# Altium project AltiumSTM32_PCB.PrjPcb
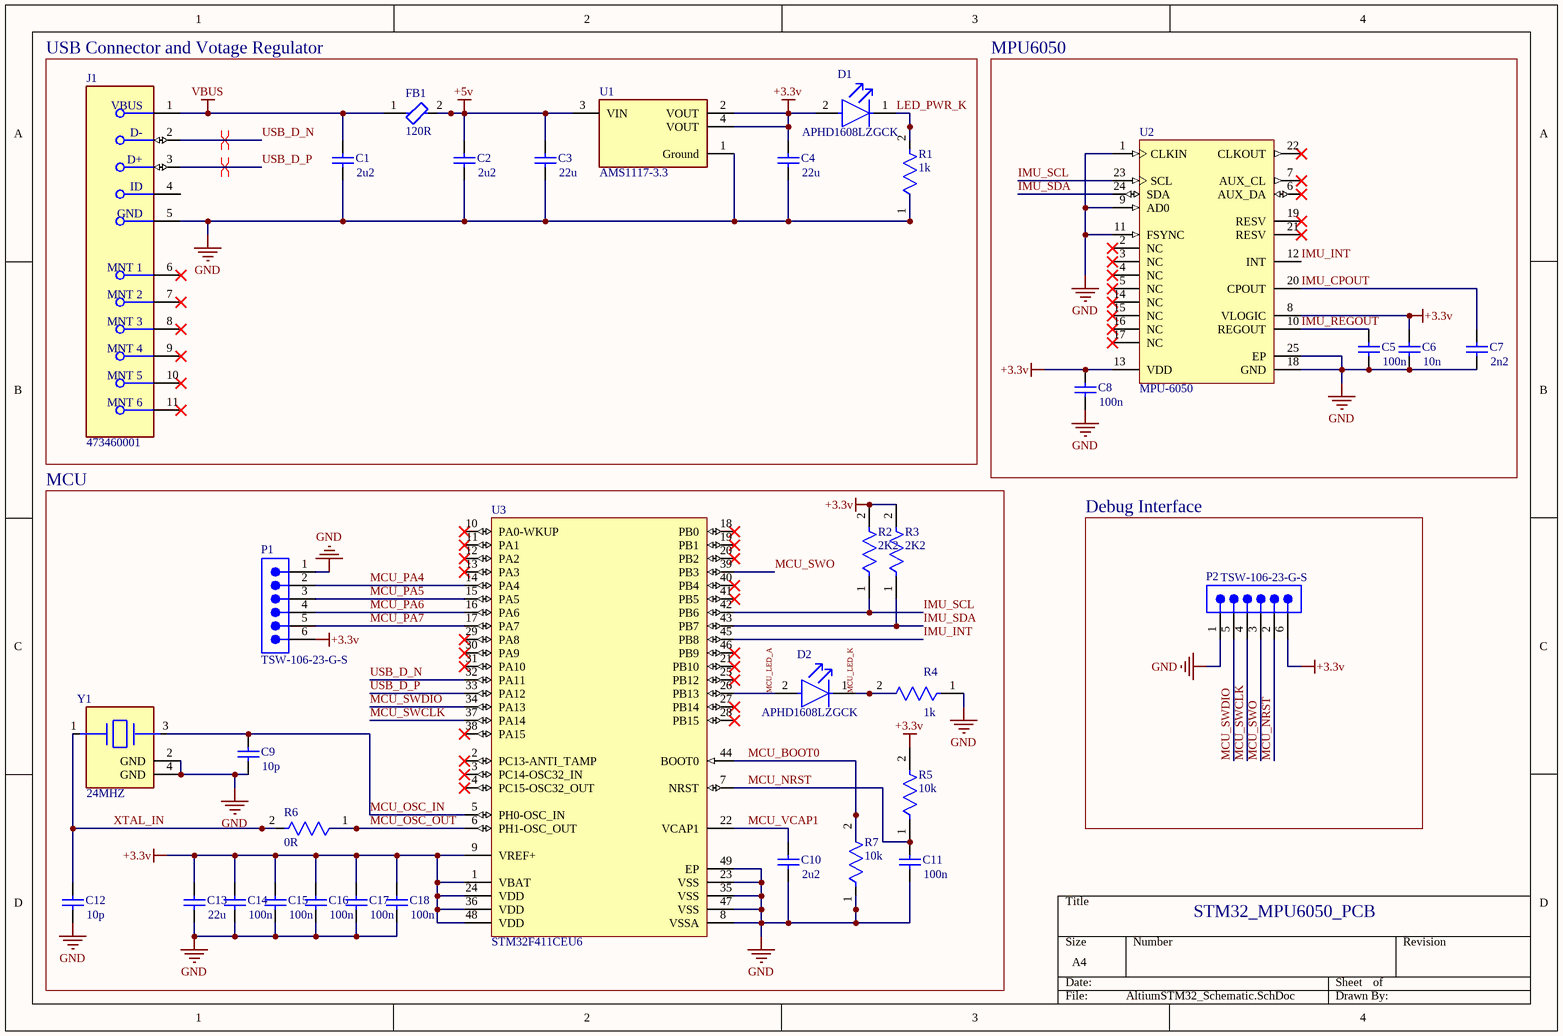
[diagram p0: AltiumSTM32_Schematic.SchDoc]
1 sheet, 35 parts. Net scope: global (net labels, ports and power ports of the same name join across sheets).
Board file: AltiumSTM32_PCB.PcbDoc

## Sheet AltiumSTM32_Schematic.SchDoc: STM32_Board
size A4; Revision: v1.0; SheetNumber: 1; SheetTotal: 1

### Parts
C1  2u2  [CAPC1608X92X38NL15T08]
C2  2u2  [CAPC1608X92X38NL15T08]
C3  22u  [CAPC1608X92X38NL15T08]
C4  22u  [CAPC1608X92X38NL15T08]
C5  100n  [CAPC1608X92X38NL15T08]
C6  10n  [CAPC1608X92X38NL15T08]
C7  2n2  [CAPC1608X92X38NL15T08]
C8  100n  [CAPC1608X92X38NL15T08]
C9  10p  [CAPC1608X92X38NL15T08]
C10  2u2  [CAPC1608X92X38NL15T08]
C11  100n  [CAPC1608X92X38NL15T08]
C12  10p  [CAPC1608X92X38NL15T08]
C13  22u  [CAPC1608X92X38NL15T08]
C14  100n  [CAPC1608X92X38NL15T08]
C15  100n  [CAPC1608X92X38NL15T08]
C16  100n  [CAPC1608X92X38NL15T08]
C17  100n  [CAPC1608X92X38NL15T08]
C18  100n  [CAPC1608X92X38NL15T08]
D1  APHD1608LZGCK  [FP-APHD1608LZGCK-MFG]
D2  APHD1608LZGCK  [FP-APHD1608LZGCK-MFG]
FB1  120R  [FP-MMZ0603-IPC_C]
J1  473460001  [FP-473460001-MFG]
P1  TSW-106-23-G-S  [SMTC-TSW-106-23-X-S]
P2  TSW-106-23-G-S  [SMTC-TSW-106-23-X-S]
R1  1k  [FP-AC0603-IPC_A]
R2  2K2  [FP-AC0603-IPC_A]
R3  2K2  [FP-AC0603-IPC_A]
R4  1k  [FP-AC0603-IPC_A]
R5  10k  [FP-AC0603-IPC_A]
R6  0R  [FP-AC0603-IPC_A]
R7  10k  [FP-AC0603-IPC_A]
U1  AMS1117-3.3  [FP-AMS1117-IPC_C]
U2  MPU-6050  [IS-QFN-24_V]
U3  STM32F411CEU6  [STM-UFQFPN48_L]
Y1  24MHZ  [FP-TSX-3225-MFG]

### Blocks framed on the sheet
USB Connector and Votage Regulator: C1-C4 D1 FB1 J1 R1 U1
MPU6050: C5-C8 U2
MCU: C9-C18 D2 P1 R2-R7 U3 Y1
Debug Interface: P2

### Nets
+3.3v: C4.2 C6.2 C8.2 C13.2 C14.2 C15.2 C16.2 C17.2 C18.2 D1.2(A) P1.6 P2.6 R2.2 R3.2 R5.2 U1.2(VOUT) U1.4(VOUT) U2.8(VLOGIC) U2.13(VDD) U3.1(VBAT) U3.9(VREF+) U3.24(VDD) U3.36(VDD) U3.48(VDD)
+5v: C2.2 C3.2 FB1.2 U1.3(VIN)
GND: C1.1 C2.1 C3.1 C4.1 C5.1 C6.1 C7.1 C8.1 C9.1 C10.1 C11.1 C12.1 C13.1 C14.1 C15.1 C16.1 C17.1 C18.1 J1.5(GND) P1.1 P2.1 R1.1 R4.1 R7.1 U1.1(Ground) U2.1(CLKIN) U2.9(AD0) U2.11(FSYNC) U2.18(GND) U2.25(EP) U3.8(VSSA) U3.23(VSS) U3.35(VSS) U3.47(VSS) U3.49(EP) Y1.2(GND) Y1.4(GND)
VBUS: C1.2 FB1.1 J1.1(VBUS)
IMU_CPOUT: C7.2 U2.20(CPOUT)
IMU_INT: U2.12(INT) U3.45(PB8)
IMU_REGOUT: C5.2 U2.10(REGOUT)
IMU_SCL: R2.1 U2.23(SCL) U3.42(PB6)
IMU_SDA: R3.1 U2.24(SDA) U3.43(PB7)
LED_PWR_K: D1.1(C) R1.2
MCU_BOOT0: R7.2 U3.44(BOOT0)
MCU_LED_A: D2.2(A) U3.26(PB13)
MCU_LED_K: D2.1(C) R4.2
MCU_NRST: C11.2 P2.2 R5.1 U3.7(NRST)
MCU_OSC_IN: C9.2 U3.5(PH0-OSC_IN) Y1.3
MCU_OSC_OUT: R6.1 U3.6(PH1-OSC_OUT)
MCU_PA4: P1.2 U3.14(PA4)
MCU_PA5: P1.3 U3.15(PA5)
MCU_PA6: P1.4 U3.16(PA6)
MCU_PA7: P1.5 U3.17(PA7)
MCU_SWCLK: P2.4 U3.37(PA14)
MCU_SWDIO: P2.5 U3.34(PA13)
MCU_SWO: P2.3 U3.39(PB3)
MCU_VCAP1: C10.2 U3.22(VCAP1)
USB_D_N: J1.2(D-) U3.32(PA11)
USB_D_P: J1.3(D+) U3.33(PA12)
XTAL_IN: C12.2 R6.2 Y1.1

Not connected (* = marked no-connect by the designer): J1 4(ID) 6(MNT_1)* 7(MNT_2)* 8(MNT_3)* 9(MNT_4)* 10(MNT_5)* 11(MNT_6)*; U2 2(NC)* 3(NC)* 4(NC)* 5(NC)* 6(AUX_DA)* 7(AUX_CL)* 14(NC)* 15(NC)* 16(NC)* 17(NC)* 19(RESV)* 21(RESV)* 22(CLKOUT)*; U3 2(PC13-ANTI_TAMP)* 3(PC14-OSC32_IN)* 4(PC15-OSC32_OUT)* 10(PA0-WKUP)* 11(PA1)* 12(PA2)* 13(PA3)* 18(PB0)* 19(PB1)* 20(PB2)* 21(PB10)* 25(PB12)* 27(PB14)* 28(PB15)* 29(PA8)* 30(PA9)* 31(PA10)* 38(PA15)* 40(PB4)* 41(PB5)* 46(PB9)*

### Layout directives
differential pair: USB_D_N, USB_D_P

### Notes on the sheet
- STM32_MPU6050_PCB

### Library data of the parts
C1-C18 = CMP-2006-01455-1: Manufacturer: Vitramon; Part Number: VJ0603A150JXAAT
D1 D2 = CMP-44529-000045-1: LED GREEN CLEAR 1608 SMD; Test Current: 2mA; Dominant Wavelength: 525nm; Lens Color: Colorless; Luminous Intensity: 180mcd; Viewing Angle: 100°; Forward Voltage: 2.65V; Lens Size: 0.7mm; Lens Style: Round; Mount: Surface Mount; Packaging: Tape and Reel; Lens Transparency: Clear; Height: 0.75mm; Case/Package: 0603; Length: 1.6mm; Case Code (Metric): 1608; Width: 0.8mm; Color: Green; Case Code (Imperial): 0603
FB1 = CMP-06046-002357-1: Chip Ferrite Bead, 1206, 1000Ω @ 100MHz, 0.075Ω, 25%, 2A; Number of Lines: 1; DC Resistance (DCR): 75mR; Max Current Rating: 2A; RoHS Compliant: Yes; Case Code (Metric): 3216; Case/Package: 1206; Mount: Surface Mount; Min Operating Temperature: -55°C; Packaging: Tape and Reel; Case Code (Imperial): 1206; Max Operating Temperature: 125°C
J1 = CMP-2000-05246-2: CONN RCPT USB2.0 MICRO B SMD R/A; Manufacturer: Molex; Conn Orientation: Right Angle; Is Female: yes; Shielding: true; Pitch: 0.65mm; Number Of Contacts: 5; Voltage Rating: 30V; Current Rating: 1.8A; Device Class L2: USB Connectors; Digikey Description: CONN RCPT USB2.0 MICRO B SMD R/A; Height: 2.945mm; RoHS: TRUE; ComponentLink2Description: Datasheet; Octopart: https://octopart.com/47346-0001-molex-7164928; Automotive: No; Package: 0; Category: Conn; Device Class L1: Connectors; Usb Standard: USB 2.0; Temperature: -30°C to +85°C; Temperature Range Low: -30°C; Footprint Url: https://www.molex.com/pdm_docs/sd/473460001_sd.pdf; ComponentLink2URL: https://www.molex.com/webdocs/datasheets/pdf/en-us/0473460001_IO_CONNECTORS.pdf; Lead Free: Yes; Manufacturer Part Number: 473460001; Contact Material: Gold,Nickel; Temperature Range High: +85°C; Device Class L3: unset
P1 P2 = CMP-1024-00396-1: 0.025" SQ Post Header, Through-hole, Vertical, -55 to 125 degC, 2.54 mm Pitch, 6-Pin, Male, RoHS; Manufacturer: Samtec; Pitch: 2.54 mm; Orientation: Vertical; Mounting Technology: Through-hole; RoHS: True; PackageVersion: DM, 8/1988; ComponentLink3Description: Package Specification; PackageDescription: .025[0.64] SQ. Post Terminal Strip Assembly; ComponentLink2URL: http://www.samtec.com/documents/webfiles/pdf/TSW_TH.PDF; PartNumber: TSW-106-23-G-S; Temperature Range: -55 to 125 degC; PackageReference: TSW-106-23-X-S; ComponentLink1Description: Manufacturer URL; ComponentLink2Description: Datasheet; ComponentLink3URL: http://www.samtec.com/documents/webfiles/cpdf/TSW-XXX-XX-XXX-X-XX-XXX-MKT.pdf; DatasheetVersion: F-214; ComponentLink1URL: http://www.samtec.com
R1-R7 = CMP-03412-029901-2: RES 8.66Ω 1.00% 0.1W 0603; RoHS Compliant: Yes
U1 = CMP-209535-000001-1: LDO Voltage Regulators 1A, 3.3V; Manufacturer: Advanced Monolithic Systems; Dropout Voltage: 1.1V; Output Type: Fixed; Nominal Supply Current: 5mA; Max Power Dissipation: 1.2W; Max Supply Voltage: 15V; Number Of Outputs: 1; Standoff Height: 0.64mm; Max Junction Temp: +125°C; Height: 1.8mm; Package: AMS1117; Device Class L2: Power Management ICs; ComponentLink2Description: Datasheet; ComponentLink2URL: http://www.advanced-monolithic.com/pdf/ds1117.pdf; Category: IC; RoHS: TRUE; Automotive: No; Device Class L1: Integrated Circuits (ICs); Output Current: 1A; Device Class L3: Voltage Regulators - Linear; Temperature: -40°C to +125°C; Output Voltage: 3.3V; Manufacturer Part Number: AMS1117-3.3; Temperature Range Low: -40°C; Octopart: https://octopart.com/ams1117-3.3-advanced+monolithic+systems-25899300; Lead Free: Yes; Ipc Land Pattern Name: SOT229P700X180-4; Temperature Range High: +125°C
U2 = CMP-1753-00002-2: 3-Axis Gyroscope, Accelerometer and a Digital Motion Processor(TM) (DMP), 2.375 to 3.46 V, -40 to 85 degC, 24-Pin QFN, RoHS, Tape and Reel; Manufacturer: InvenSense; Featured Product: MPU-60506-Axis,IntegratedI²CSolution; Other Names: 1428-1007-2 / MPU6050; Sensor Type: MotionTracking; Online Catalog: MPU-6000™Series; Unit PriceUSD: Digital; Datasheet Version: Rev. 3.3, 05/2012; Category: Sensors,Transducers; Datasheet URL: http://datasheet.octopart.com/MPU-6050-InvenSense-datasheet-14421344.pdf; Family: Multifunction; Standard Package: 5,000; Manufacturer URL: http://www.invensense.com/; Output Type: Digital; Dynamic Catalog: MPU-6000™Series
U3 = CMP-0243-00165-1: ARM Cortex-M4 32-bit MCU+FPU, 512 KB Flash, 128 KB RAM, 36 I/Os, 48-Pin UFQFPN, -40 to 85 degC, Tray; Operating Frequency(F) (Processor speed) (MHz): 100; FLASH Size (Prog) (kB): 512; Internal RAM Size (kB): 128; I/Os (High Current): 36; Supply Voltage(Vcc) min (V): 1.7; Package Reference: 48-Pin Ultra Thin Fine Pitch Quad Flat No-Lead, 7 x 7 x 0.6 mm Body, 0.5 mm Pitch, Exposed Pad; ComponentLink1Description: Manufacturer URL; ComponentLink1URL: http://www.st.com/; Packing: Tray; Package Description: UFQFPN48; Core: ARM Cortex-M4; ComponentLink2Description: Datasheet; ComponentLink2URL: http://www.st.com/st-web-ui/static/active/en/resource/technical/document/datasheet/DM00115249.pdf; DatasheetVersion: Rev. 6; Mounting Technology: Surface Mount
Y1 = CMP-36405-000018-1: CRYSTAL 24.0000MHZ 9PF SMD; ESR (Equivalent Series Resistance): 40R; Frequency Stability: 20ppm; Tolerance: 10ppm; Drive Level: 200uW; Min Operating Temperature: -40°C; RoHS Compliant: Yes; Width: 2.5mm; Max Operating Temperature: 105°C; Package Quantity: 250; Load Capacitance: 9pF; Mount: Surface Mount; Lead Free: Lead Free; Height: 0.024inch; Depth: 2.5mm; Frequency: 24MHz; Packaging: Tape and Reel; Series: TSX-3225; Weight: 0.000564oz; Number of Pins: 4; Termination: SMD/SMT; Case/Package: SMD/SMT; Length: 3.2mm; Frequency Tolerance: 10ppm